# Altium schematic sheet Block_Diagram.SchDoc
size 292 x 193 mm; CompanyName: EmbeddedSystems.do; SheetNumber: 1; SheetTotal: 3
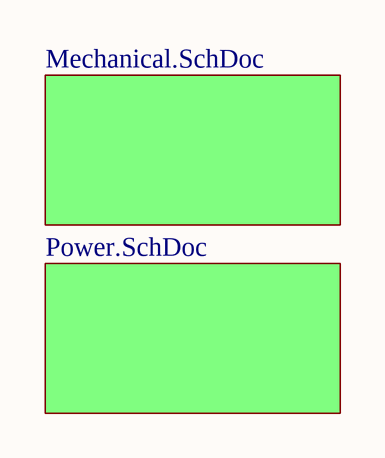
[diagram p0: Block_Diagram.SchDoc]

## Sub-sheets
U_Mechanical = Mechanical.SchDoc: no entries
U_Power = Power.SchDoc: no entries

## Notes on the sheet
- Title:
- Author:
- Project name:
- Reviewer:
- Approved by:
- Date:
- Part number:
- Revision:
- Page:
- /